# Altium project PGS-System.PrjPcb (part 3 of 16)

## Sheet PoE_PSE_CONTROLLER.SchDoc
size 420 x 297 mm; SheetNumber: 2; SheetTotal: 27
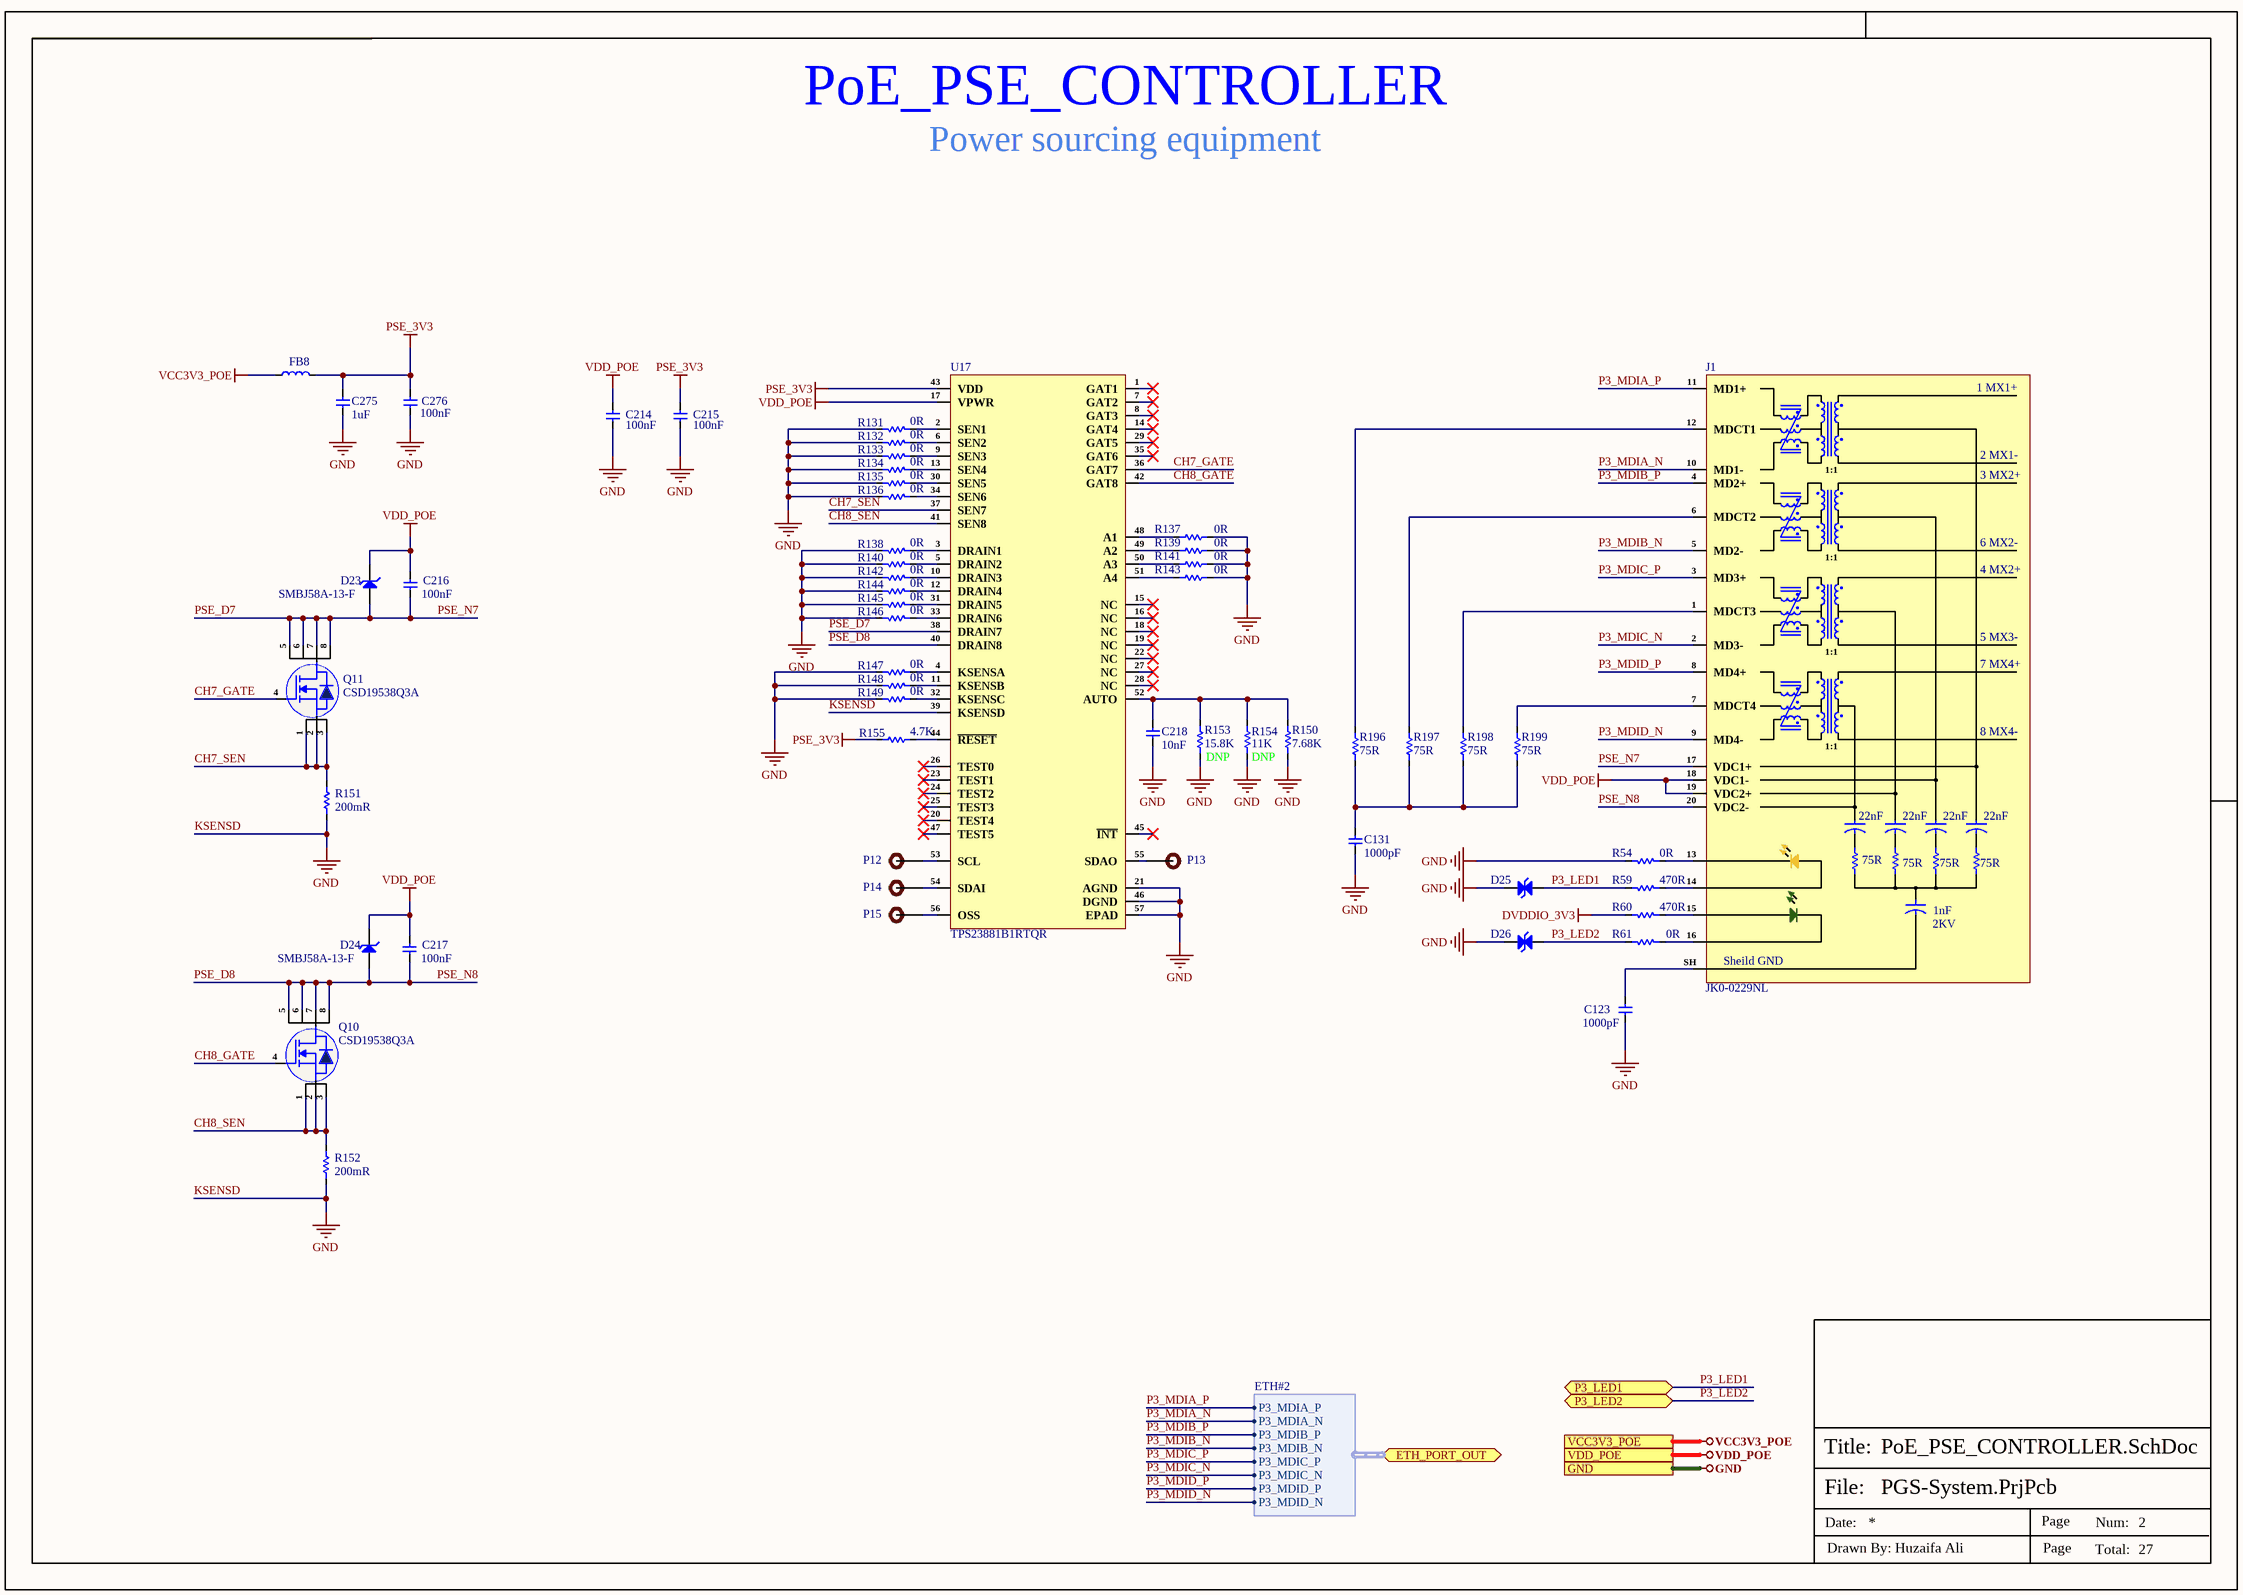
[diagram p1: PoE_PSE_CONTROLLER.SchDoc]

### Parts
C123  1000pF  [Cap-1206]
C131  1000pF  [Cap-1206]
C214  100nF  [Cap-0603]
C215  100nF  [Cap-0603]
C216  100nF  [Cap-0603]
C217  100nF  [Cap-0603]
C218  10nF  [Cap-0402]
C275  1uF  [Cap-0402]
C276  100nF  [Cap-0402]
D23  SMBJ58A-13-F  [SMB_]
D24  SMBJ58A-13-F  [SMB_]
D25  ESD9X5VU  [DFN1006-2L_]  (value not drawn)
D26  ESD9X5VU  [DFN1006-2L_]  (value not drawn)
FB8  742792641  [IND-0603 (1608 Metric)]  (value not drawn)
J1  JK0-0229NL  [JK0-0229NL]
P12  TEST POINT 0.5mm Dia  [Test-point - 0.5mm]  (value not drawn)  (no BOM)
P13  TEST POINT 0.5mm Dia  [Test-point - 0.5mm]  (value not drawn)  (no BOM)
P14  TEST POINT 0.5mm Dia  [Test-point - 0.5mm]  (value not drawn)  (no BOM)
P15  TEST POINT 0.5mm Dia  [Test-point - 0.5mm]  (value not drawn)  (no BOM)
Q10  CSD19538Q3A  [VSONP-8(3.1x3.1)]
Q11  CSD19538Q3A  [VSONP-8(3.1x3.1)]
R54  0R  [Res-0402]
R59  470R  [Res-0402]
R60  470R  [Res-0402]
R61  0R  [Res-0402]
R131  0R  [Res-0402]
R132  0R  [Res-0402]
R133  0R  [Res-0402]
R134  0R  [Res-0402]
R135  0R  [Res-0402]
R136  0R  [Res-0402]
R137  0R  [Res-0402]
R138  0R  [Res-0402]
R139  0R  [Res-0402]
R140  0R  [Res-0402]
R141  0R  [Res-0402]
R142  0R  [Res-0402]
R143  0R  [Res-0402]
R144  0R  [Res-0402]
R145  0R  [Res-0402]
R146  0R  [Res-0402]
R147  0R  [Res-0402]
R148  0R  [Res-0402]
R149  0R  [Res-0402]
R150  7.68K  [Res-0402]
R151  200mR  [Res-1206]
R152  200mR  [Res-1206]
R153  DNP  [Res-0402]
R154  DNP  [Res-0402]
R155  4.7K  [Res-0402]
R196  75R  [Res-0402]
R197  75R  [Res-0402]
R198  75R  [Res-0402]
R199  75R  [Res-0402]
U17  TPS23881B1RTQR  [56-VQFN (8x8)]

### Ports
ETH_PORT_OUT (bidir, harness ETH#2, see ETH_SWITCH_INTERFACE[4D]), GND (see BUCK_CONTROLLER_SHEET[3D], DDR3_SDRAM_SHEET[5D], DEBUG_UART_INTERFACE[3D], DIGITAL_MEMS_INTERFACE[3C], eMMC_INTERFACE[3D], ETH_PoE-PD_INTERFACE[4D], ETH_SWITCH_INTERFACE[5D], IR-CUT_LIGHT SENSOR_SHEET[3D], MIPI TO HDMI_MODULE[3D], MIPI-CSI_RXX_INTERFACE[3C], POWER_LDO_SHEET[3D], POWER_PMIC_RK809_CODEC[3C], POWER_PMIC_RK809_DC DC[3D], POWER_PMIC_RK809_LDO[4C], POWER_PMIC_RK809_MGM[3D], RV1126_AUDIO_SHEET[3D], RV1126_DRAM_SHEET[4C], RV1126_eMMC_SPI-FLASH[3C], RV1126_ETHERNET_SHEET[3D], RV1126_OSC-PLL-PMUIO[3C], RV1126_POWER_SHEET[1D], RV1126_SARADC_SHEET[3C], RV1126_SDMMC_SHEET[3C], SPI_FLASH_INTERFACE[3D], USB2.0_DEBUG_UART[3D], WIFI_AP6256_SHEET[3C]), P3_LED1 (bidir, see ETH_SWITCH_INTERFACE[5C]), P3_LED2 (bidir, see ETH_SWITCH_INTERFACE[5C]), VCC3V3_POE (see ETH_SWITCH_INTERFACE[5D], POWER_LDO_SHEET[3D]), VDD_POE (see BUCK_CONTROLLER_SHEET[3D], ETH_PoE-PD_INTERFACE[4D])

### Harnesses
ETH#2: P3_MDIA_P, P3_MDIA_N, P3_MDIB_P, P3_MDIB_N, P3_MDIC_P, P3_MDIC_N, P3_MDID_P, P3_MDID_N

### Nets
DVDDIO_3V3: R60.2
KSENSD: C123.1 C131.1 C214.1 C215.1 C218.1 C275.1 C276.1 D25.1(A) D26.1(A) R54.2 R131.2 R132.2 R133.2 R134.2 R135.2 R136.2 R137.2 R138.2 R139.2 R140.2 R141.2 R142.2 R143.2 R144.2 R145.2 R146.2 R147.2 R148.2 R149.2 R150.2 R151.1 R152.1 R153.1 R154.1 U17.21(AGND) U17.39(KSENSD) U17.46(DGND) U17.57(EPAD) ; port GND  [also labelled GND]
PSE_3V3: C215.2 C275.2 C276.2 FB8.2 R155.1 U17.43(VDD)
VCC3V3_POE: FB8.1 ; port VCC3V3_POE
VDD_POE: C214.2 C216.2 C217.2 D23.2(K) D24.2(K) J1.18(VDC1-) J1.19(VDC2+) U17.17(VPWR) ; port VDD_POE
CH7_GATE: Q11.4(G) U17.36(GAT7)
CH7_SEN: Q11.1(S) Q11.2(S) Q11.3(S) R151.2 U17.37(SEN7)
CH8_GATE: Q10.4(G) U17.42(GAT8)
CH8_SEN: Q10.1(S) Q10.2(S) Q10.3(S) R152.2 U17.41(SEN8)
P3_LED1: D25.2(A) R59.2 ; port P3_LED1
P3_LED2: D26.2(A) R61.2 ; port P3_LED2
P3_MDIA_N: J1.10(MD1-) ; port ETH_PORT_OUT.P3_MDIA_N
P3_MDIA_P: J1.11(MD1+) ; port ETH_PORT_OUT.P3_MDIA_P
P3_MDIB_N: J1.5(MD2-) ; port ETH_PORT_OUT.P3_MDIB_N
P3_MDIB_P: J1.4(MD2+) ; port ETH_PORT_OUT.P3_MDIB_P
P3_MDIC_N: J1.2(MD3-) ; port ETH_PORT_OUT.P3_MDIC_N
P3_MDIC_P: J1.3(MD3+) ; port ETH_PORT_OUT.P3_MDIC_P
P3_MDID_N: J1.9(MD4-) ; port ETH_PORT_OUT.P3_MDID_N
P3_MDID_P: J1.8(MD4+) ; port ETH_PORT_OUT.P3_MDID_P
PSE_D7: C216.1 D23.1(A) J1.17(VDC1+) Q11.5(D) Q11.6(D) Q11.7(D) Q11.8(D) U17.38(DRAIN7)  [also labelled PSE_N7]
PSE_D8: C217.1 D24.1(A) J1.20(VDC2-) Q10.5(D) Q10.6(D) Q10.7(D) Q10.8(D) U17.40(DRAIN8)  [also labelled PSE_N8]
NetC123_2: C123.2 J1.SH(Shield_GND)
NetC131_2: C131.2 R196.1 R197.1 R198.1 R199.1
NetC218_2: C218.2 R150.1 R153.2 R154.2 U17.52(AUTO)
NetJ1_1: J1.1(MDCT3) R198.2
NetJ1_6: J1.6(MDCT2) R197.2
NetJ1_7: J1.7(MDCT4) R199.2
NetJ1_12: J1.12(MDCT1) R196.2
NetJ1_13: J1.13(Cathode) R54.1
NetJ1_14: J1.14(Anode) R59.1
NetJ1_15: J1.15(ANODE) R60.1
NetJ1_16: J1.16(Cathode) R61.1
NetP12_1: P12.1 U17.53(SCL)
NetP13_1: P13.1 U17.55(SDAO)
NetP14_1: P14.1 U17.54(SDAI)
NetP15_1: P15.1 U17.56(OSS)
NetR131_1: R131.1 U17.2(SEN1)
NetR132_1: R132.1 U17.6(SEN2)
NetR133_1: R133.1 U17.9(SEN3)
NetR134_1: R134.1 U17.13(SEN4)
NetR135_1: R135.1 U17.30(SEN5)
NetR136_1: R136.1 U17.34(SEN6)
NetR137_1: R137.1 U17.48(A1)
NetR138_1: R138.1 U17.3(DRAIN1)
NetR139_1: R139.1 U17.49(A2)
NetR140_1: R140.1 U17.5(DRAIN2)
NetR141_1: R141.1 U17.50(A3)
NetR142_1: R142.1 U17.10(DRAIN3)
NetR143_1: R143.1 U17.51(A4)
NetR144_1: R144.1 U17.12(DRAIN4)
NetR145_1: R145.1 U17.31(DRAIN5)
NetR146_1: R146.1 U17.33(DRAIN6)
NetR147_1: R147.1 U17.4(KSENSA)
NetR148_1: R148.1 U17.11(KSENSB)
NetR149_1: R149.1 U17.32(KSENSC)
NetR155_2: R155.2 U17.44(~{RESET})

Not connected (* = marked no-connect by the designer): U17 1(GAT1)* 7(GAT2)* 8(GAT3)* 14(GAT4)* 15(NC)* 16(NC)* 18(NC)* 19(NC)* 20(TEST4)* 22(NC)* 23(TEST1)* 24(TEST2)* 25(TEST3)* 26(TEST0)* 27(NC)* 28(NC)* 29(GAT5)* 35(GAT6)* 45(~{INT})* 47(TEST5)*

### Notes on the sheet
- PoE_PSE_CONTROLLER
- Power sourcing equipment
- (near R153) 15.8K
- (near R154) 11K
- File:
- Title:
- Date:
- Page
- Num:
- Total:
- Drawn By: Huzaifa Ali
- (in symbol JK0-0229NL) 1 MX1+; 2 MX1-; 1:1; 3 MX2+; 6 MX2-; 4 MX2+; 5 MX3-; 7 MX4+; 8 MX4-; 22nF; 75R; 1nF; 2KV; Sheild GND

### Library data of the parts
C123 C131 = CC1206KKX7RDBB102: as C122 on sheet ETH_PoE-PD_INTERFACE; Supplier 1: Digi-Key; Manufacturer Part Number: CC1206KKX7RDBB102; RoHS: Yes; Category: Ceramic Capacitors; Stock 1: 19260; Pricing 1: 1=0.35000, 10=0.24000, 50=0.16780, 100=0.14390, 500=0.10794, 1000=0.09114 (USD); Mount: Surface Mount; Case/Package: 1206; Number of Pins: 2; Case Code (Metric): 3216; Case Code (Imperial): 1206; Min Operating Temperature: -55°C; Max Operating Temperature: 125°C; Dielectric: X7R; Voltage: 2kV; Package Quantity: 1; Voltage Rating: 2kV; Packaging: Tape and Reel; Voltage Rating (DC): 2kV; Termination: SMD/SMT; Resistor Type: Ceramic; Series: CC; Construction: Flat; Length: 3.2mm; Width: 0.063inch; Height: 1.25mm; Depth: 1.6mm; Thickness: 0.057inch; Radiation Hardening: No; RoHS Compliant: Yes; REACH SVHC: Unknown; Lead Free: Lead Free; ComponentLink1URL: https://datasheet.ciiva.com/23942/1449957-23942422.pdf?src-supplier=Newark; ComponentLink1Description: https://datasheet.ciiva.com/23942/1449957-23942422.pdf?src-supplier=Newark; ComponentLink2URL: https://datasheet.ciiva.com/186/upy-np0x7r-hv-1kv-to-3kv-4-186736.pdf?src-supplier=Digi-Key; ComponentLink2Description: https://datasheet.ciiva.com/186/upy-np0x7r-hv-1kv-to-3kv-4-186736.pdf?src-supplier=Digi-Key; ComponentLink3URL: https://datasheet.ciiva.com/186/upy-np0x7r-hv-1kv-to-3kv-4-186737.pdf?src-supplier=Digi-Key; ComponentLink3Description: https://datasheet.ciiva.com/186/upy-np0x7r-hv-1kv-to-3kv-4-186737.pdf?src-supplier=Digi-Key; ComponentLink4URL: https://datasheet.ciiva.com/13386/upy-gp-np0-16v-to-50v-8-13386312.pdf?src-supplier=Mouser; ComponentLink4Description: https://datasheet.ciiva.com/13386/upy-gp-np0-16v-to-50v-8-13386312.pdf?src-supplier=Mouser; ComponentLink5URL: https://datasheet.ciiva.com/186/upy-np0x7r-hv-1kv-to-3kv-4-186735.pdf?src-supplier=Digi-Key; ComponentLink5Description: https://datasheet.ciiva.com/186/upy-np0x7r-hv-1kv-to-3kv-4-186735.pdf?src-supplier=Digi-Key; Supplier Part Number 1: 311-1487-1-ND; LCSC Part Number: C23631
C214-C217 = CC0603KRX7R0BB104: CAP CER 0.1UF 100V X7R 0603; Manufacturer: Yageo; Tolerance: 10%; Item Type: Capacitor; Supplier 1: Digi-Key; Manufacturer Part Number: CC0603KRX7R0BB104; RoHS: Yes; Category: Ceramic Capacitors; Stock 1: 60476; Pricing 1: 1=0.19000, 10=0.13500, 50=0.07680, 100=0.06370, 500=0.04466, 1000=0.03696 (USD); Mount: Surface Mount; Case/Package: 0603; Case Code (Metric): 1608; Case Code (Imperial): 0603; Weight: 7.1E-05oz; Min Operating Temperature: -55°C; Max Operating Temperature: 125°C; Package Quantity: 4000; Capacitance: 100nF; Voltage Rating: 100V; Packaging: Tape and Reel; Dielectric: X7R; Termination: SMD/SMT; Resistor Type: Ceramic; Voltage Rating (DC): 100V; Series: CC; Length: 0.063inch; Width: 0.031inch; Thickness: 0.035inch; Depth: 0.8mm; Lead Free: Lead Free; RoHS Compliant: Yes; ComponentLink1URL: https://datasheet.ciiva.com/6277/mlccorderingcode-6277030.pdf?src-supplier=Digi-Key; ComponentLink1Description: https://datasheet.ciiva.com/6277/mlccorderingcode-6277030.pdf?src-supplier=Digi-Key; ComponentLink2URL: https://datasheet.ciiva.com/6277/mlccorderingcode-6277081.pdf?src-supplier=Digi-Key; ComponentLink2Description: https://datasheet.ciiva.com/6277/mlccorderingcode-6277081.pdf?src-supplier=Digi-Key; ComponentLink3URL: https://datasheet.ciiva.com/6277/mlccorderingcode-6277082.pdf?src-supplier=Digi-Key; ComponentLink3Description: https://datasheet.ciiva.com/6277/mlccorderingcode-6277082.pdf?src-supplier=Digi-Key; Supplier Part Number 1: 311-1523-1-ND; LCSC Part Number: C113803
C218 = CC0402KRX7R0BB103: CAP CER 10000PF 100V X7R 0402; Manufacturer: Yageo; Item Type: Capacitors; Material: Ceramic; Tolerance: 10%; Supplier: Arrow Electronics; LCSC Part Number: C527014; Manufacturer Part Number: CC0402KRX7R0BB103; RoHS: Yes; Stock: 60000; Pricing: 10000=0.0098, 20000=0.0097, 30000=0.0092, 50000=0.0091, 100000=0.009, 250000=0.0089 (USD); Case/Package: 0402; Min Operating Temperature: -55°C; Max Operating Temperature: 125°C; Value: 10nF; Voltage Rating: 100V; Height: 550um; RoHS Compliant: Yes; ComponentLink1URL: https://datasheet.octopart.com/CC0402KRX7R0BB103-Yageo-datasheet-166511530.pdf?src-supplier=Future+Electronics; ComponentLink1Description: https://datasheet.octopart.com/CC0402KRX7R0BB103-Yageo-datasheet-166511530.pdf?src-supplier=Future+Electronics; ComponentLink2URL: https://datasheet.octopart.com/CC0402KRX7R0BB103-Yageo-datasheet-153410991.pdf?src-supplier=Farnell; ComponentLink2Description: https://datasheet.octopart.com/CC0402KRX7R0BB103-Yageo-datasheet-153410991.pdf?src-supplier=Farnell
C275 = CC0402KRX5R7BB105: CAP CER 1UF 16V X5R 0402; Manufacturer: Yageo; Tolerance: 10%; Item Type: Capacitor; Supplier 1: Digi-Key; Manufacturer Part Number: CC0402KRX5R7BB105; Stock 1: 1405667; Pricing 1: 1=0.36, 10=0.252, 100=0.1512, 500=0.1134, 1000=0.09576, 2500=0.09072, 5000=0.08568 (USD); Mount: Surface Mount; Case/Package: 0402; Weight: 2.3E-05oz; Case Code (Imperial): 0402; Case Code (Metric): 1005; Min Operating Temperature: -55°C; Max Operating Temperature: 85°C; Capacitance: 1uF; Dielectric: X5R; Packaging: Tape and Reel; Voltage Rating (DC): 16V; Voltage Rating: 16V; Termination: SMD/SMT; Composition: Ceramic; Length: 1mm; Height: 0.5mm; Width: 0.02inch; Thickness: 0.022inch; Depth: 0.5mm; Radiation Hardening: No; Lead Free: Lead Free; Halogen Free: Halogen Free; ComponentLink1URL: http://www.yageo.com/documents/recent/UPY-GPHC_X5R_4V-to-50V_12.pdf?src-supplier=Avnet+Europe; ComponentLink1Description: http://www.yageo.com/documents/recent/UPY-GPHC_X5R_4V-to-50V_12.pdf?src-supplier=Avnet+Europe; Supplier Part Number 1: 311-1691-6-ND; LCSC Part Number: C325464
C276 = CC0402KRX5R7BB104: CAP CER 0.1UF 16V X5R 0402; Manufacturer: Yageo; Tolerance: 10%; Supplier 1: Mouser; Manufacturer Part Number: CC0402KRX5R7BB104; RoHS: Yes; Category: Ceramic Capacitors; Stock 1: 936792; Pricing 1: 1=0.10000, 10=0.02300, 50=0.02300, 100=0.01100, 1000=0.00600, 10000=0.00400 (USD); Mount: Surface Mount; Case/Package: 0402; Case Code (Imperial): 0402; Case Code (Metric): 1005; Min Operating Temperature: -55°C; Max Operating Temperature: 85°C; Capacitance: 100nF; Packaging: Tape and Reel; Voltage Rating: 16V; Dielectric: X5R; Termination: SMD/SMT; Voltage Rating (DC): 16V; Package Quantity: 1; Length: 1mm; Width: 0.02inch; Thickness: 0.022inch; Lead Free: Lead Free; Halogen Free: Halogen Free; ComponentLink1URL: https://datasheet.ciiva.com/155/mlccorderingcode-155879.pdf?src-supplier=Digi-Key; ComponentLink1Description: https://datasheet.ciiva.com/155/mlccorderingcode-155879.pdf?src-supplier=Digi-Key; ComponentLink2URL: https://datasheet.ciiva.com/155/mlccorderingcode-155878.pdf?src-supplier=Digi-Key; ComponentLink2Description: https://datasheet.ciiva.com/155/mlccorderingcode-155878.pdf?src-supplier=Digi-Key; ComponentLink3URL: https://datasheet.ciiva.com/155/mlccorderingcode-155880.pdf?src-supplier=Digi-Key; ComponentLink3Description: https://datasheet.ciiva.com/155/mlccorderingcode-155880.pdf?src-supplier=Digi-Key; Supplier Part Number 1: 603-CC402KRX5R7BB104; LCSC Part Number: C106204; Number of Pins: 2; Resistor Type: Ceramic; Series: CC; Construction: Flat; Height: 0.5mm; Depth: 0.5mm; Radiation Hardening: No; REACH SVHC: Unknown; RoHS Compliant: Yes; ComponentLink4URL: https://datasheet.ciiva.com/11464/upy-gphc-x5r-4v-to-50v-12-11464869.pdf?src-supplier=Avnet; ComponentLink4Description: https://datasheet.ciiva.com/11464/upy-gphc-x5r-4v-to-50v-12-11464869.pdf?src-supplier=Avnet
D23 D24 = SMBJ58A-13-F: as D28 on sheet ETH_PoE-PD_INTERFACE; Supplier: Future Electronics; LCSC Part Number: C135085; Manufacturer Part Number: SMBJ58A-13-F; RoHS: Yes; Item Type: Diode; Stock: 6000; Pricing: 3000=0.0711, 9000=0.0684, 15000=0.0671, 30000=0.0655, 60000=0.063 (USD); ComponentLink1URL: https://datasheet.ciiva.com/25624/0900766b8104bed2-25624843.pdf?src-supplier=Rs; ComponentLink1Description: https://datasheet.ciiva.com/25624/0900766b8104bed2-25624843.pdf?src-supplier=Rs; ComponentLink2URL: https://datasheet.ciiva.com/15143/getdatasheetpartid-39642-15143045.pdf?src-supplier=Verical; ComponentLink2Description: https://datasheet.ciiva.com/15143/getdatasheetpartid-39642-15143045.pdf?src-supplier=Verical; ComponentLink3URL: https://datasheet.ciiva.com/4520/ds19002-4520617.pdf?src-supplier=Mouser; ComponentLink3Description: https://datasheet.ciiva.com/4520/ds19002-4520617.pdf?src-supplier=Mouser; ComponentLink4URL: https://datasheet.ciiva.com/16393/ds19002-16393005.pdf?src-supplier=Future+Electronics; ComponentLink4Description: https://datasheet.ciiva.com/16393/ds19002-16393005.pdf?src-supplier=Future+Electronics
D25 D26 = ESD9X5VU: as D6 on sheet ETH_PoE-PD_INTERFACE; Manufacturer Part Number: ESD9X5VU; Footprint: DFN1006-2; ComponentLink1Description: LCSC; ComponentLink1URL: https://www.lcsc.com/product-detail/span-style-background-color-ff0-ESD-span-Protection-Devices_TECH-PUBLIC-ESD9X5VU_C2875160.html; LCSC Part Number: C2875160
FB8 = 742792641: FERRITE BEAD 300 OHM 0603 1LN; Manufacturer: Wurth Electronics; RMS Current (Irms): 2A; ESR: 150mR; Tolerance: 25%; Impedance: 300R; Number of Lines: 1; Test Frequency: 100MHz; Value: 18nH; Supplier: Digikey; LCSC Part Number: C2649308; Manufacturer Part Number: 742792641; RoHS: Yes; Item Type: Ferrite Bead; Stock: 95770; Pricing: 1=0.18, 50=0.179, 100=0.165, 500=0.158, 1000=0.15, 2000=0.143 (USD); Mounting Technology: Surface Mount; Case/Package: SMD/SMT; Weight: 0.000141oz; Core Material: Ferrite; Case Code (Metric): 1608; Case Code (Imperial): 0603; Material: Ferrite; Min Operating Temperature: -55°C; Max Operating Temperature: 125°C; Package Quantity: 1; Current Rating: 2A; Packaging: Tape and Reel; Max Current Rating: 2A; Max DC Current: 2A; Termination: SMD/SMT; Series: WE-CBF; Length: 1.6mm; Width: 0.8mm; Height: 0.8mm; Depth: 0.8mm; Lead Free: Lead Free; Reach SVHC Compliant: Unknown; RoHS Compliant: Yes; ComponentLink1URL: https://datasheet.ciiva.com/1466/1705830-1466501.pdf?src-supplier=Element14; ComponentLink1Description: https://datasheet.ciiva.com/1466/1705830-1466501.pdf?src-supplier=Element14; ComponentLink2URL: https://datasheet.ciiva.com/11800/0900766b80d2e072-11800409.pdf?src-supplier=Rs; ComponentLink2Description: https://datasheet.ciiva.com/11800/0900766b80d2e072-11800409.pdf?src-supplier=Rs; ComponentLink3URL: https://datasheet.ciiva.com/4940/742792641-72209-4940450.pdf?src-supplier=Mouser; ComponentLink3Description: https://datasheet.ciiva.com/4940/742792641-72209-4940450.pdf?src-supplier=Mouser; ComponentLink4URL: https://datasheet.ciiva.com/1013/742792641-1013888.pdf?src-supplier=Digikey; ComponentLink4Description: https://datasheet.ciiva.com/1013/742792641-1013888.pdf?src-supplier=Digikey; ComponentLink5URL: https://datasheet.ciiva.com/1466/1705830-1466502.pdf?src-supplier=Element14; ComponentLink5Description: https://datasheet.ciiva.com/1466/1705830-1466502.pdf?src-supplier=Element14; ComponentLink6URL: https://datasheet.ciiva.com/1013/742792641-1013889.pdf?src-supplier=Digikey; ComponentLink6Description: https://datasheet.ciiva.com/1013/742792641-1013889.pdf?src-supplier=Digikey
J1 = JK0-0229NL: Modular Connectors / Ethernet Connectors 1000Base-T RJ45 1X1 1GPoE 140W; Manufacturer: Pulse; Item Type: Modular / Ethernet Connectors; Supplier: Arrow Electronics; Supplier Part Number: JK0-0229NL; Manufacturer Part Number: JK0-0229NL; RoHS: Yes; Stock: 10080; Pricing: 225=7.169, 270=6.882, 450=6.835, 540=6.738, 945=6.675 (USD); ComponentLink1URL: http://datasheet.octopart.com/JK0-0229NL-Pulse-datasheet-137249669.pdf?src-supplier=Mouser; ComponentLink1Description: http://datasheet.octopart.com/JK0-0229NL-Pulse-datasheet-137249669.pdf?src-supplier=Mouser; ComponentLink2URL: http://datasheet.octopart.com/JK0-0229NL-Pulse-datasheet-137249669.pdf?src-supplier=Avnet; ComponentLink2Description: http://datasheet.octopart.com/JK0-0229NL-Pulse-datasheet-137249669.pdf?src-supplier=Avnet; ComponentLink3URL: http://datasheet.octopart.com/JK0-0229NL-Pulse-datasheet-137249669.pdf?src-supplier=Digikey; ComponentLink3Description: http://datasheet.octopart.com/JK0-0229NL-Pulse-datasheet-137249669.pdf?src-supplier=Digikey; ComponentLink4URL: http://datasheet.octopart.com/JK0-0229NL-Pulse-datasheet-137249669.pdf?src-supplier=Future+Electronics; ComponentLink4Description: http://datasheet.octopart.com/JK0-0229NL-Pulse-datasheet-137249669.pdf?src-supplier=Future+Electronics; ComponentLink5URL: http://datasheet.octopart.com/JK0-0229NL-Pulse-datasheet-137249669.pdf?src-supplier=Onlinecomponents.com; ComponentLink5Description: http://datasheet.octopart.com/JK0-0229NL-Pulse-datasheet-137249669.pdf?src-supplier=Onlinecomponents.com; ComponentLink6URL: https://datasheet.octopart.com/JK0-0229NL-Pulse-datasheet-137249669.pdf?src-supplier=Electro+Sonic; ComponentLink6Description: https://datasheet.octopart.com/JK0-0229NL-Pulse-datasheet-137249669.pdf?src-supplier=Electro+Sonic; ComponentLink7URL: http://datasheet.octopart.com/JK0-0229NL-Pulse-datasheet-137249669.pdf?src-supplier=Sager+Electronics; ComponentLink7Description: http://datasheet.octopart.com/JK0-0229NL-Pulse-datasheet-137249669.pdf?src-supplier=Sager+Electronics; ComponentLink8URL: http://datasheet.octopart.com/JK0-0229NL-Pulse-datasheet-137249669.pdf?src-supplier=TTI; ComponentLink8Description: http://datasheet.octopart.com/JK0-0229NL-Pulse-datasheet-137249669.pdf?src-supplier=TTI
P12-P15 = TEST POINT 0.5mm Dia: Test Point ON; Item Type: Test Point; Manufacturer Part Number: TEST POINT 0.5mm Dia
Q10 Q11 = CSD19538Q3A: MOSFET N-CH 100V 15A 8VSON; Manufacturer: Texas Instruments; Item Type: IC; Drain to Source Resistance: 49mR; Gate to Source Voltage (Vgs): 20V; Number of Channels: 1NUMBER; Power Dissipation: 2.8W; Turn-Off Delay Time: 7ns; Turn-On Delay Time: 5ns; Supplier: Mouser; LCSC Part Number: C478471; Manufacturer Part Number: CSD19538Q3A; RoHS: Yes; Stock: 14931; Pricing: 1=0.57, 10=0.496, 50=0.496, 100=0.343, 1000=0.244, 10000=0.19 (USD); Drain to Source Breakdown Voltage: 100V; Length: 3.3mm; Width: 3.3mm; Height: 900um; Thickness: 800um; Lead Free: 5697LeadFree; ComponentLink1URL: http://www.ti.com/lit/ds/symlink/csd19538q3a.pdf?src-supplier=Digikey; ComponentLink1Description: http://www.ti.com/lit/ds/symlink/csd19538q3a.pdf?src-supplier=Digikey
R54 R61 R131-R149 = RC0402FR-070RL: as R55 on sheet ETH_PoE-PD_INTERFACE; Supplier 1: Mouser; Manufacturer Part Number: RC0402FR-070RL; RoHS: Yes; Stock 1: 8556842; Pricing 1: 1=0.10000, 10=0.01400, 50=0.01400, 100=0.00600, 1000=0.00300, 5000=0.00200, 10000=0.00100 (USD); Mount: Surface Mount; Case/Package: 0402; Contact Plating: Tin,Matte; Case Code (Imperial): 0402; Case Code (Metric): 1005; Size Code: 0402; Min Operating Temperature: -55°C; Max Operating Temperature: 155°C; Resistance: 0R; Resistor Type: Thick Film; Packaging: Tape and Reel; Termination: SMD/SMT; Features: Moisture Resistant; Series: RC; Number of Terminations: 2; Length: 1mm; Width: 0.5mm; Height: 0.35mm; Radiation Hardening: No; Lead Free: Lead Free; RoHS Compliant: Yes; ComponentLink1URL: https://datasheet.ciiva.com/8896/pyu-rc0402-51-rohs-l-6-8896149.pdf?src-supplier=Avnet; ComponentLink1Description: https://datasheet.ciiva.com/8896/pyu-rc0402-51-rohs-l-6-8896149.pdf?src-supplier=Avnet; ComponentLink2URL: https://datasheet.ciiva.com/16790/pyu-rc0402-51-rohs-l-6-r-16790444.pdf?src-supplier=Future+Electronics; ComponentLink2Description: https://datasheet.ciiva.com/16790/pyu-rc0402-51-rohs-l-6-r-16790444.pdf?src-supplier=Future+Electronics; Supplier Part Number 1: 603-RC0402FR-070RL; LCSC Part Number: C106231
R59 R60 = RC0402FR-07470RL: as R56 on sheet ETH_PoE-PD_INTERFACE; Supplier: Avnet; Supplier Part Number: RC0402FR-07470RL; Manufacturer Part Number: RC0402FR-07470RL; RoHS: Yes; Stock: 10000; Pricing: 10000=0.00085 (USD); Case/Package: 0402; Case Code (Metric): 1005; Case Code (Imperial): 0402; Min Operating Temperature: -55°C; Max Operating Temperature: 155°C; Packaging: Tape and Reel; Value: 470R; Tolerance: 1%; Number of Terminations: 2; Working Voltage: 50V; Package Quantity: 1; Resistor Type: Thick Film; Termination: SMD/SMT; Features: Moisture Resistant; Series: RC; Resistance Tolerance: 1%; Construction: Rectangular; Voltage Rating (AC): 50V; Length: 1mm; Width: 0.02inch; Height: 0.016inch; Depth: 0.5mm; Lead Free: Lead Free; Reach SVHC Compliant: No; RoHS Compliant: Yes; Military Standard: Not; ComponentLink1URL: https://datasheet.ciiva.com/46412/1018594-46412838.pdf?src-supplier=Element14; ComponentLink1Description: https://datasheet.ciiva.com/46412/1018594-46412838.pdf?src-supplier=Element14; ComponentLink2URL: https://datasheet.ciiva.com/2453/pyu-r-int-thick-7-2453377.pdf?src-supplier=Digikey; ComponentLink2Description: https://datasheet.ciiva.com/2453/pyu-r-int-thick-7-2453377.pdf?src-supplier=Digikey; ComponentLink3URL: https://datasheet.ciiva.com/2453/pyu-r-int-thick-7-2453378.pdf?src-supplier=Digikey; ComponentLink3Description: https://datasheet.ciiva.com/2453/pyu-r-int-thick-7-2453378.pdf?src-supplier=Digikey; ComponentLink4URL: https://datasheet.ciiva.com/2453/pyu-r-int-thick-7-2453376.pdf?src-supplier=Digikey; ComponentLink4Description: https://datasheet.ciiva.com/2453/pyu-r-int-thick-7-2453376.pdf?src-supplier=Digikey; ComponentLink5URL: https://datasheet.ciiva.com/7850/1018594-7850015.pdf?src-supplier=Element14; ComponentLink5Description: https://datasheet.ciiva.com/7850/1018594-7850015.pdf?src-supplier=Element14; ComponentLink6URL: https://datasheet.ciiva.com/7850/1018594-7850014.pdf?src-supplier=Element14; ComponentLink6Description: https://datasheet.ciiva.com/7850/1018594-7850014.pdf?src-supplier=Element14; ComponentLink7URL: https://datasheet.ciiva.com/15189/getdatasheetpartid-330246-15189463.pdf?src-supplier=Verical; ComponentLink7Description: https://datasheet.ciiva.com/15189/getdatasheetpartid-330246-15189463.pdf?src-supplier=Verical; LCSC Part Number: C114877
R150 = RT0402BRD077K68L: RES SMD 7.68KOHM 0.1% 1/16W 0402; Manufacturer: Yageo; Item Type: Resistors; Supplier: Mouser; LCSC Part Number: C852919; Manufacturer Part Number: RT0402BRD077K68L; RoHS: Yes; Stock: 6579; Pricing: 1=0.16, 10=0.121, 50=0.096, 100=0.086, 1000=0.061, 10000=0.038 (USD); ComponentLink1URL: https://datasheet.ciiva.com/12724/pyu-rt-1-to-0-05-rohs-l-4-12724831.pdf?src-supplier=Mouser; ComponentLink1Description: https://datasheet.ciiva.com/12724/pyu-rt-1-to-0-05-rohs-l-4-12724831.pdf?src-supplier=Mouser
R151 R152 = PE1206FRF470R2L: RES 0.2 OHM 1% 1W 1206; Manufacturer: Yageo; Item Type: Resistors; Temperature Coefficient: 100ppm/°C; Supplier: Digikey; LCSC Part Number: C723709; Manufacturer Part Number: PE1206FRF470R2L; RoHS: Yes; Stock: 7734; Pricing: 1=0.63, 10=0.459, 25=0.368, 50=0.2732, 100=0.1927, 250=0.17164, 500=0.14714, 1000=0.1121 (USD); Case/Package: 340Case; Packaging: 10Packaging; Value: 200mR; RoHS Compliant: Yes
R153 = 0402WGF1582TCE: 62.5mW Thick Film Resistors 50V ±100ppm/℃ ±1% 15.8kΩ 0402 Chip Resistor - Surface Mount ROHS; Manufacturer: Royal Electronic Factory; Value: 15.8kR; Supplier: Mouser; LCSC Part Number: C26956; Manufacturer Part Number: 0402WGF1582TCE; RoHS: No; Item Type: Resistor; Stock: 10000; Pricing: 10000=0.004 (USD)
R154 = RC0402FR-0711KL: RES 11K OHM 1% 1/16W 0402; Manufacturer: Yageo; Item Type: Resistors; Power Rating: 63mW; Voltage Rating: 50V; Value: 11kR; Temperature Coefficient: 100ppm/°C; Supplier: Future Electronics; LCSC Part Number: C138063; Manufacturer Part Number: RC0402FR-0711KL; RoHS: Yes; Stock: 350000; Pricing: 10000=0.0018, 100000=0.0011, 150000=0.0017, 300000=0.001, 500000=0.0016, 750000=0.001, 1500000=0.0015, 2000000=0.0009, 5000000=0.0014 (USD); Case/Package: 0402; Pins: 2; Case Code (Metric): 1005; Case Code (Imperial): 0402; Min Operating Temperature: -55°C; Max Operating Temperature: 155°C; Tolerance: 1%; Packaging: Tape and Reel; Package Quantity: 1; Resistor Type: Thick Film; Number of Terminations: 2; Termination: SMD/SMT; Max Power Dissipation: 63mW; Voltage Rating (DC): 50V; Features: Moisture Resistant; Series: RC; Resistance Tolerance: 1%; Length: 0.039inch; Width: 0.02inch; Height: 0.016inch; RoHS Compliant: Yes; Reach SVHC Compliant: No; Lead Free: Lead Free; ComponentLink1URL: https://datasheet.ciiva.com/5999/1018594-5999918.pdf?src-supplier=Farnell; ComponentLink1Description: https://datasheet.ciiva.com/5999/1018594-5999918.pdf?src-supplier=Farnell; ComponentLink2URL: https://datasheet.ciiva.com/2453/pyu-r-int-thick-7-2453641.pdf?src-supplier=Digikey; ComponentLink2Description: https://datasheet.ciiva.com/2453/pyu-r-int-thick-7-2453641.pdf?src-supplier=Digikey; ComponentLink3URL: https://datasheet.ciiva.com/2453/pyu-r-int-thick-7-2453642.pdf?src-supplier=Digikey; ComponentLink3Description: https://datasheet.ciiva.com/2453/pyu-r-int-thick-7-2453642.pdf?src-supplier=Digikey; ComponentLink4URL: https://datasheet.ciiva.com/2453/pyu-r-int-thick-7-2453640.pdf?src-supplier=Digikey; ComponentLink4Description: https://datasheet.ciiva.com/2453/pyu-r-int-thick-7-2453640.pdf?src-supplier=Digikey; ComponentLink5URL: https://datasheet.ciiva.com/12668/pyu-rc0402-51-rohs-l-6-r-12668234.pdf?src-supplier=Mouser; ComponentLink5Description: https://datasheet.ciiva.com/12668/pyu-rc0402-51-rohs-l-6-r-12668234.pdf?src-supplier=Mouser
R155 = RC0402FR-074K7L: RES 4.7K OHM 1% 1/16W 0402; Manufacturer: Yageo; Voltage Rating (DC): 50V; Power Rating: 62.5mW; Resistance: 4.7kR; Temperature Coefficient: 100ppm/°C; Max Power Dissipation: 63mW; Item Type: Resistor; Supplier 1: Avnet; Manufacturer Part Number: RC0402FR-074K7L; RoHS: Yes; Category: Chip SMD Resistors; Stock 1: 2420000; Pricing 1: 10000=0.00085 (USD); Case/Package: 0402; Number of Pins: 2; Case Code (Imperial): 0402; Case Code (Metric): 1005; Size Code: 0402; Min Operating Temperature: -55°C; Max Operating Temperature: 155°C; Tolerance: 1%; Voltage Rating: 50V; Packaging: Tape and Reel; Resistor Type: Thick Film; Termination: SMD/SMT; Features: Moisture Resistant; Series: RC; Number of Terminations: 2; Resistance Tolerance: 1%; Construction: Rectangular; Length: 1mm; Width: 0.5mm; Height: 0.32mm; Depth: 0.5mm; Height - Seated (Max): 0.016inch; RoHS Compliant: Yes; Reach SVHC Compliant: Yes; Military Standard: Not; Lead Free: Lead Free; ComponentLink1URL: https://datasheet.ciiva.com/22661/1686128-22661342.pdf?src-supplier=Element14; ComponentLink1Description: https://datasheet.ciiva.com/22661/1686128-22661342.pdf?src-supplier=Element14; ComponentLink2URL: https://datasheet.ciiva.com/7850/1018594-7850022.pdf?src-supplier=Element14; ComponentLink2Description: https://datasheet.ciiva.com/7850/1018594-7850022.pdf?src-supplier=Element14; ComponentLink3URL: https://datasheet.ciiva.com/7850/1018594-7850023.pdf?src-supplier=Element14; ComponentLink3Description: https://datasheet.ciiva.com/7850/1018594-7850023.pdf?src-supplier=Element14; ComponentLink4URL: https://datasheet.ciiva.com/15215/getdatasheetpartid-328119-15215035.pdf?src-supplier=Verical; ComponentLink4Description: https://datasheet.ciiva.com/15215/getdatasheetpartid-328119-15215035.pdf?src-supplier=Verical; Supplier Part Number 1: RC0402FR-074K7L; LCSC Part Number: C105871
R196-R199 = RC0402JR-0775RL: as R123 on sheet ETH_PoE-PD_INTERFACE; Supplier: Digikey; Supplier Part Number: 311-75JRCT-ND; Manufacturer Part Number: RC0402JR-0775RL; RoHS: Yes; Stock: 2993323; Pricing: 1=0.1, 10=0.018, 50=0.0102, 100=0.0083, 500=0.00528, 1000=0.00444, 5000=0.00307 (USD); Case/Package: 0402; Pins: 2; Contact Plating: Tin,Lead; Case Code (Imperial): 0402; Case Code (Metric): 1005; Min Operating Temperature: -55°C; Max Operating Temperature: 155°C; Value: 75R; Tolerance: 5%; Resistor Type: Thick Film; Packaging: Tape and Reel; Termination: SMD/SMT; Voltage Rating (DC): 50V; Features: Moisture Resistant; Series: RC; Number of Terminations: 2; Resistance Tolerance: 5%; Length: 1mm; Width: 0.5mm; Height: 0.35mm; Reach SVHC Compliant: No; Lead Free: Lead Free; RoHS Compliant: Yes; ComponentLink1URL: https://datasheet.ciiva.com/7983/1018594-7983612.pdf?src-supplier=Element14; ComponentLink1Description: https://datasheet.ciiva.com/7983/1018594-7983612.pdf?src-supplier=Element14; ComponentLink2URL: https://datasheet.ciiva.com/17082/pyu-rc0402-51-rohs-l-6-r-17082239.pdf?src-supplier=Future+Electronics; ComponentLink2Description: https://datasheet.ciiva.com/17082/pyu-rc0402-51-rohs-l-6-r-17082239.pdf?src-supplier=Future+Electronics; LCSC Part Number: C137841
U17 = TPS23881B1RTQR: TYPE-4, FOUR-PAIR, 8-CHANNEL POE; Manufacturer: Texas Instruments; Item Type: IC; Supplier: DigiKey; Supplier Part Number: 296-TPS23881B1RTQRTR-ND; Manufacturer Part Number: TPS23881B1RTQR; Pricing: 2000=4.40512 (USD)